# Altium schematic sheet Power_Sch.SchDoc
size A3; SheetNumber: 5; SheetTotal: 6
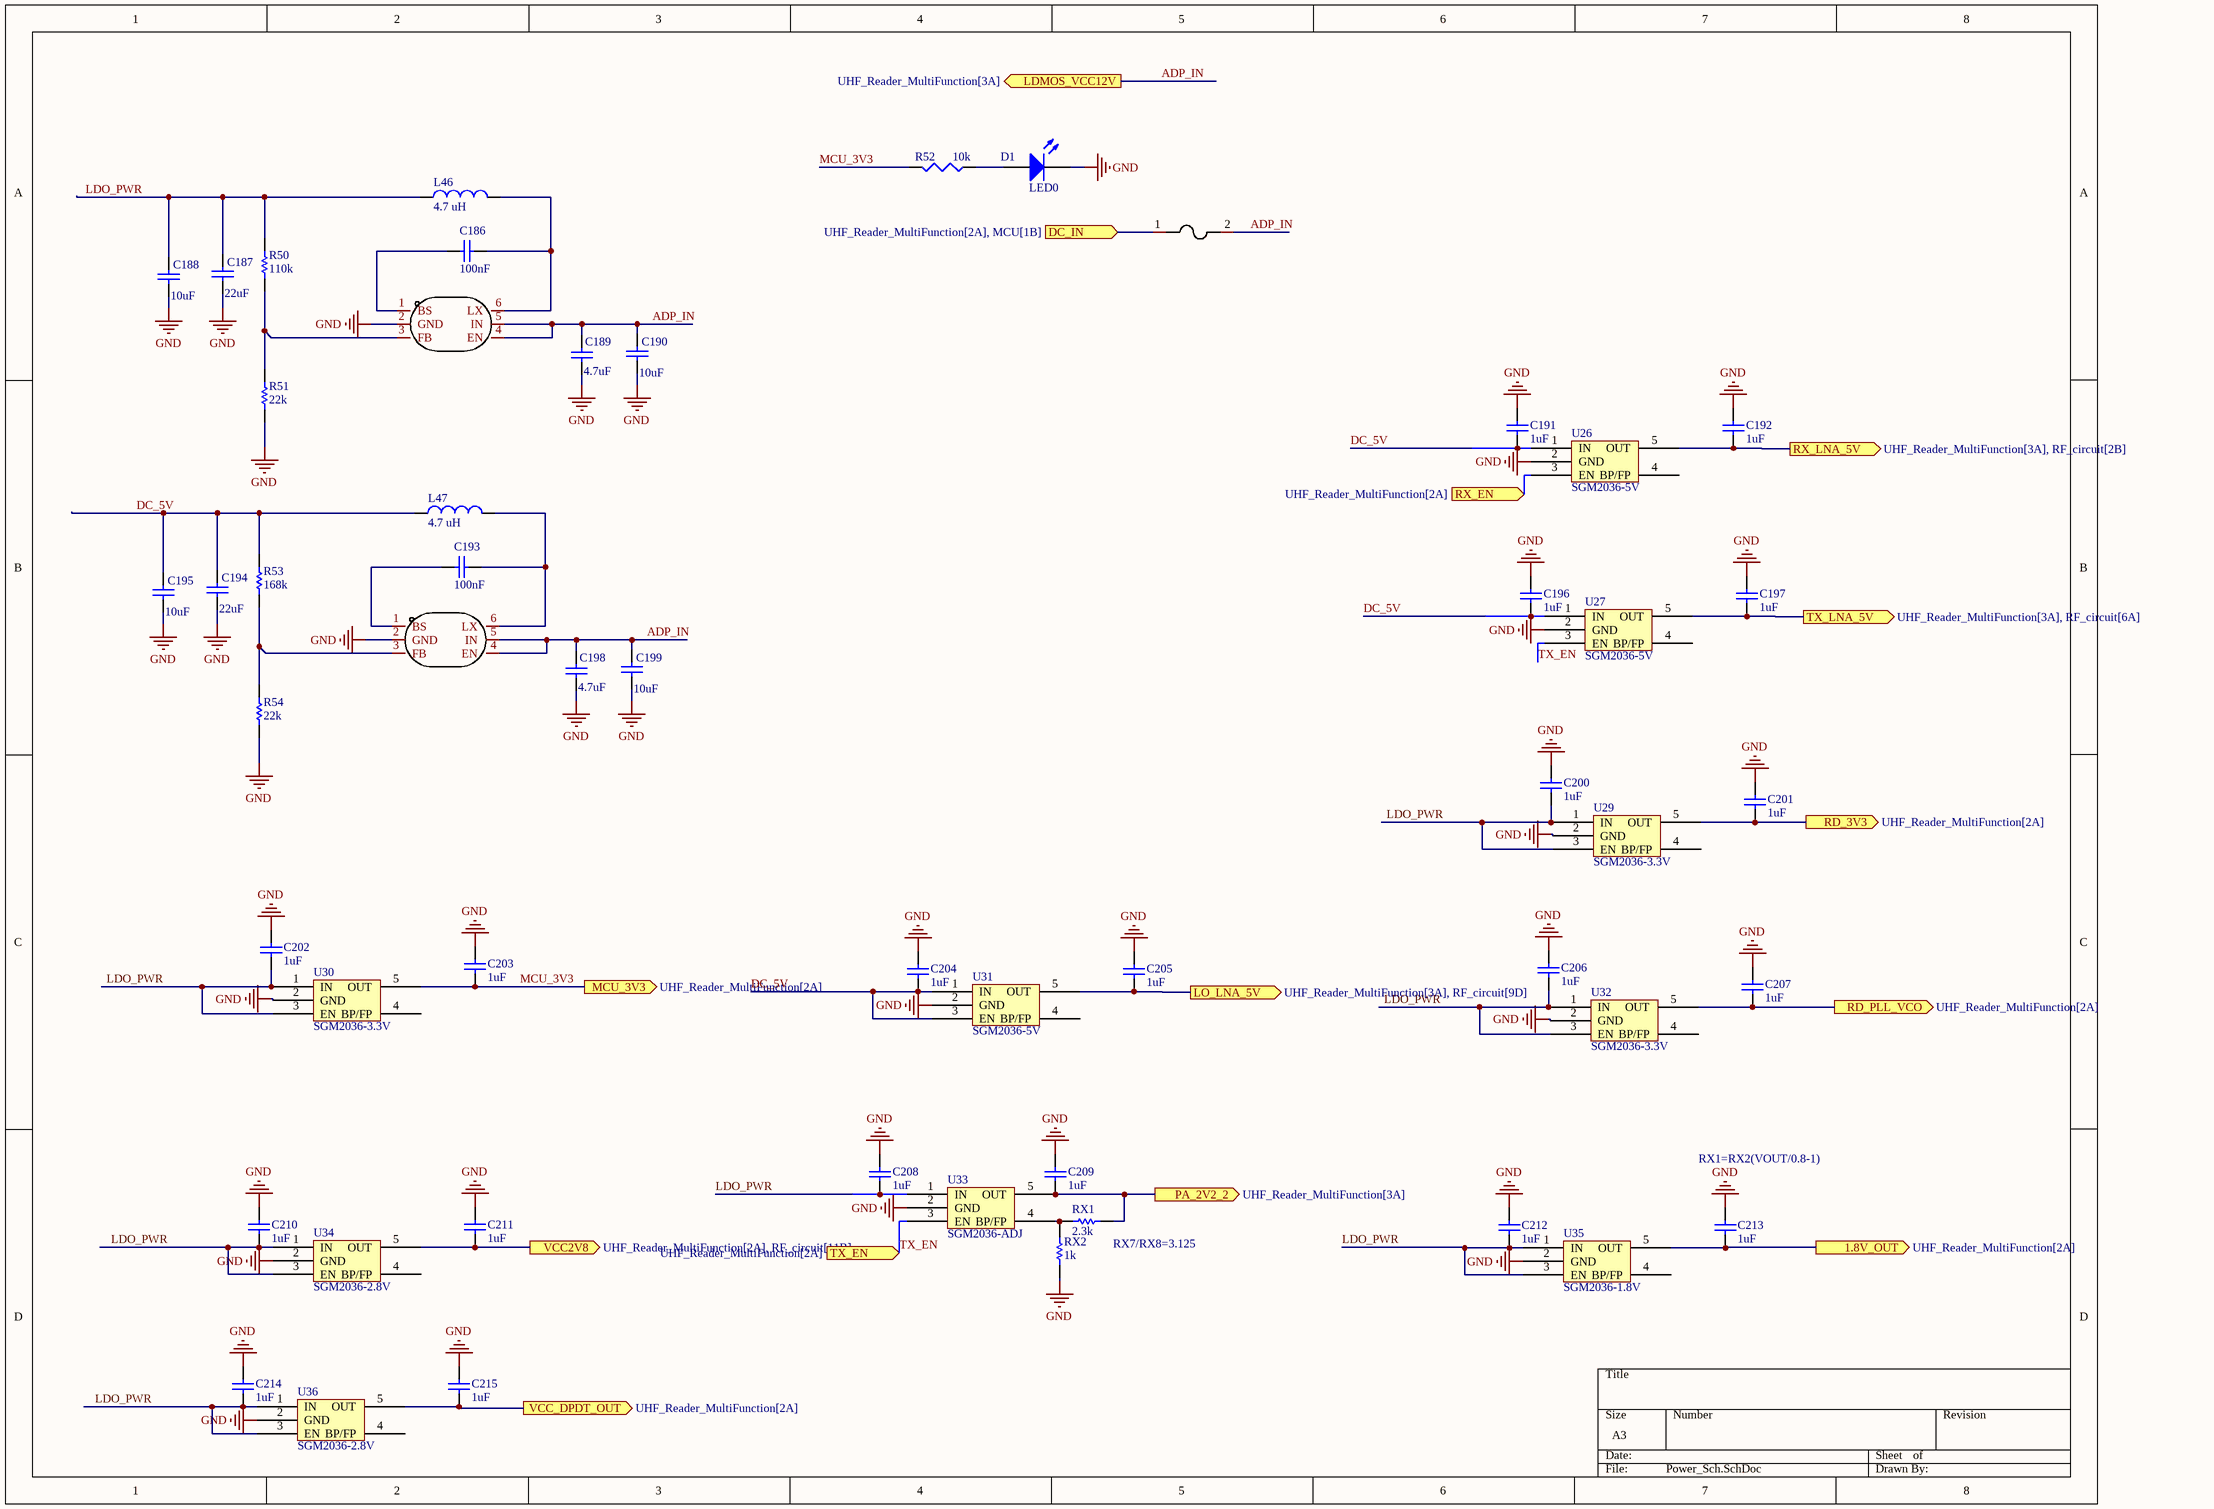
[diagram p0: Power_Sch.SchDoc]

## Parts
C186  100nF  [0402_Z]
C187  22uF  [0805_Z]
C188  10uF  [0805_Z]
C189  4.7uF  [0805_Z]
C190  10uF  [0805_Z]
C191  1uF  [0603_Z]
C192  1uF  [0603_Z]
C193  100nF  [0402_Z]
C194  22uF  [0805_Z]
C195  10uF  [0805_Z]
C196  1uF  [0603_Z]
C197  1uF  [0603_Z]
C198  4.7uF  [0805_Z]
C199  10uF  [0805_Z]
C200  1uF  [0603_Z]
C201  1uF  [0603_Z]
C202  1uF  [0603_Z]
C203  1uF  [0603_Z]
C204  1uF  [0603_Z]
C205  1uF  [0603_Z]
C206  1uF  [0603_Z]
C207  1uF  [0603_Z]
C208  1uF  [0603_Z]
C209  1uF  [0603_Z]
C210  1uF  [0603_Z]
C211  1uF  [0603_Z]
C212  1uF  [0603_Z]
C213  1uF  [0603_Z]
C214  1uF  [0603_Z]
C215  1uF  [0603_Z]
D1  LED0  [0603_Z]
F1  JFC1206-1300FS  [F1206]  (value not drawn)
L46  4.7 uH  [INDC 4040X25N]
L47  4.7 uH  [INDC 4040X25N]
R50  110k  [0603_Z]
R51  22k  [0603_Z]
R52  10k  [0402_Z]
R53  168k  [0603_Z]
R54  22k  [0603_Z]
RX1  2.3k  [0402_Z]
RX2  1k  [0402_Z]
U25  SY8121BABC  [SOT-23-6_L2.9-W1.6-P0.95-LS2.8-TL]  (value not drawn)
U26  SGM2036-5V  [SOT-23-5]
U27  SGM2036-5V  [SOT-23-5]
U28  SY8121BABC  [SOT-23-6_L2.9-W1.6-P0.95-LS2.8-TL]  (value not drawn)
U29  SGM2036-3.3V  [SOT-23-5]
U30  SGM2036-3.3V  [SOT-23-5]
U31  SGM2036-5V  [SOT-23-5]
U32  SGM2036-3.3V  [SOT-23-5]
U33  SGM2036-ADJ  [SOT-23-5]
U34  SGM2036-2.8V  [SOT-23-5]
U35  SGM2036-1.8V  [SOT-23-5]
U36  SGM2036-2.8V  [SOT-23-5]

## Ports
1.8V_OUT (out, see UHF_Reader_MultiFunction[2A]), DC_IN (in, see UHF_Reader_MultiFunction[2A], MCU[1B]), LDMOS_VCC12V (out, see UHF_Reader_MultiFunction[3A]), LO_LNA_5V (out, see UHF_Reader_MultiFunction[3A], RF_circuit[9D]), MCU_3V3 (out, see UHF_Reader_MultiFunction[2A]), PA_2V2_2 (out, see UHF_Reader_MultiFunction[3A]), RD_3V3 (out, see UHF_Reader_MultiFunction[2A]), RD_PLL_VCO (out, see UHF_Reader_MultiFunction[2A]), RX_EN (in, see UHF_Reader_MultiFunction[2A]), RX_LNA_5V (out, see UHF_Reader_MultiFunction[3A], RF_circuit[2B]), TX_EN (in, see UHF_Reader_MultiFunction[2A]), TX_LNA_5V (out, see UHF_Reader_MultiFunction[3A], RF_circuit[6A]), VCC2V8 (out, see UHF_Reader_MultiFunction[2A], RF_circuit[11B]), VCC_DPDT_OUT (out, see UHF_Reader_MultiFunction[2A])

## Nets
GND: C187.2 C188.2 C189.2 C190.2 C191.2 C192.2 C194.2 C195.2 C196.2 C197.2 C198.2 C199.2 C200.2 C201.2 C202.2 C203.2 C204.2 C205.2 C206.2 C207.2 C208.2 C209.2 C210.2 C211.2 C212.2 C213.2 C214.2 C215.2 D1.2(K) R51.1 R54.1 RX2.2 U25.2(GND) U26.2(GND) U27.2(GND) U28.2(GND) U29.2(GND) U30.2(GND) U31.2(GND) U32.2(GND) U33.2(GND) U34.2(GND) U35.2(GND) U36.2(GND)
1.8V_OUT: C213.1 U35.5(OUT) ; port 1.8V_OUT
ADP_IN: C189.1 C190.1 C198.1 C199.1 F1.2 U25.4(EN) U25.5(IN) U28.4(EN) U28.5(IN) ; port LDMOS_VCC12V
DC_5V: C191.1 C194.1 C195.1 C196.1 C204.1 L47.1 R53.2 U26.1(IN) U27.1(IN) U31.1(IN) U31.3(EN)
DC_IN: F1.1 ; port DC_IN
LDO_PWR: C187.1 C188.1 C200.1 C202.1 C206.1 C208.1 C210.1 C212.1 C214.1 L46.1 R50.2 U29.1(IN) U29.3(EN) U30.1(IN) U30.3(EN) U32.1(IN) U32.3(EN) U33.1(IN) U34.1(IN) U34.3(EN) U35.1(IN) U35.3(EN) U36.1(IN) U36.3(EN)
LO_LNA_5V: C205.1 U31.5(OUT) ; port LO_LNA_5V
MCU_3V3: C203.1 R52.2 U30.5(OUT) ; port MCU_3V3
PA_2V2_2: C209.1 RX1.2 U33.5(OUT) ; port PA_2V2_2
RD_3V3: C201.1 U29.5(OUT) ; port RD_3V3
RD_PLL_VCO: C207.1 U32.5(OUT) ; port RD_PLL_VCO
RX_EN: U26.3(EN) ; port RX_EN
RX_LNA_5V: C192.1 U26.5(OUT) ; port RX_LNA_5V
TX_EN: U27.3(EN) U33.3(EN) ; port TX_EN
TX_LNA_5V: C197.1 U27.5(OUT) ; port TX_LNA_5V
VCC2V8: C211.1 U34.5(OUT) ; port VCC2V8
VCC_DPDT_OUT: C215.1 U36.5(OUT) ; port VCC_DPDT_OUT
NetC186_1: C186.1 L46.2 U25.6(LX)
NetC186_2: C186.2 U25.1(BS)
NetC193_1: C193.1 L47.2 U28.6(LX)
NetC193_2: C193.2 U28.1(BS)
NetD1_1: D1.1(A) R52.1
NetR50_1: R50.1 R51.2 U25.3(FB)
NetR53_1: R53.1 R54.2 U28.3(FB)
NetRX1_1: RX1.1 RX2.1 U33.4(BP/FP)

Not connected (* = marked no-connect by the designer): U26 4(BP/FP); U27 4(BP/FP); U29 4(BP/FP); U30 4(BP/FP); U31 4(BP/FP); U32 4(BP/FP); U34 4(BP/FP); U35 4(BP/FP); U36 4(BP/FP)

## Notes on the sheet
- RX1=RX2(VOUT/0.8-1)
- (near RX1) RX7/RX8=3.125

## Library data of the parts
C186-C215 = Cap: Capacitor; Value: 100pF; Published: 8-Jun-2000; LatestRevisionDate: 17-Jul-2002; LatestRevisionNote: Re-released for DXP Platform.; PackageReference: RAD-0.3; Publisher: Altium Limited; PackageDescription: Radial Cap, Thru-Hole; 2 Leads; 0.3 in Pin Spacing
D1 = LED0: Typical INFRARED GaAs LED; Published: 8-Jun-2000; LatestRevisionDate: 08-Jul-2005; LatestRevisionNote: Mech Layer 1 removed.; PackageReference: LED-0; Publisher: Altium Limited; PackageDescription: LED; 2 Leads
F1 = JFC1206-1300FS: Manufacturer: JDTfuse(集电通); Add into BOM: yes; Fuse Type: 快速熔断; Breaking Capacity @ Rated Voltage: 50A; Rated Voltage(DC): 24V/32V/63V/72V; Current Rating: 3A; Nominal Voltage Drop: 187mV; Melting I²t: 1.39; Nominal Cold Resistance: 53mΩ; Name: JFC1206-1300FS; Symbol: JFC1206-1300FS; Device: JFC1206-1300FS; LCSC Part Name: 3A 63V 快断; Supplier Part: C136347; Manufacturer Part: JFC1206-1300FS; Supplier Footprint: 1206; JLCPCB Part Class: Extended Part; Datasheet: https://atta.szlcsc.com/upload/public/pdf/source/20171023/C136347_15087480789771053481.pdf; Supplier: LCSC; Convert to PCB: yes; Product: 贴片式保险丝; Operating Temperature: -55°C ~ 125°C; Rated Voltage(AC): -
L46 L47 = Inductor: Code_IEC: 1005; Value: 10mH; Published: 8-Jun-2000; LatestRevisionDate: 29-May-2009; LatestRevisionNote: IPC-7351 Footprint Added.; PackageReference: 0402-A; Publisher: Altium Limited; PackageDescription: Chip Inductor; Code_JEITA: 0402
R50 R51 R53 R54 RX1 = Res1: Resistor; Value: 1K; Published: 8-Jun-2000; LatestRevisionDate: 17-Jul-2002; LatestRevisionNote: Re-released for DXP Platform.; PackageReference: AXIAL-0.3; Publisher: Altium Limited; PackageDescription: Axial Device, Thru-Hole; 2 Leads; 0.3 in Pin Spacing
R52 = Res3: Resistor; Published: 8-Jun-2000; LatestRevisionDate: 04-Mar-2005; LatestRevisionNote: PCB Footprint replaced.; PackageReference: J1-0603; Publisher: Altium Limited; Value: 10k
RX2 = Res1: Resistor; Published: 8-Jun-2000; LatestRevisionDate: 17-Jul-2002; LatestRevisionNote: Re-released for DXP Platform.; PackageReference: AXIAL-0.3; Publisher: Altium Limited; PackageDescription: Axial Device, Thru-Hole; 2 Leads; 0.3 in Pin Spacing; Value: 1K
U25 U28 = SY8121BABC: Manufacturer: silergy(矽力杰); Add into BOM: yes; Name: SY8121BABC; Symbol: SY8121BABC; Device: SY8121BABC; LCSC Part Name: SY8121BABC; Supplier Part: C3014423; Manufacturer Part: SY8121BABC; Supplier Footprint: SOT-23-6; JLCPCB Part Class: Extended Part; Datasheet: https://atta.szlcsc.com/upload/public/pdf/source/20220628/778B77D6DFC0D9CB89BA787A0CD3FE92.pdf; Supplier: LCSC; Convert to PCB: yes
U26 U27 U29-U36 = sgm2036